# Altium schematic sheet RK3568-VO-Interface-1.SchDoc
size 420 x 297 mm; SheetNumber: 11; SheetTotal: 25
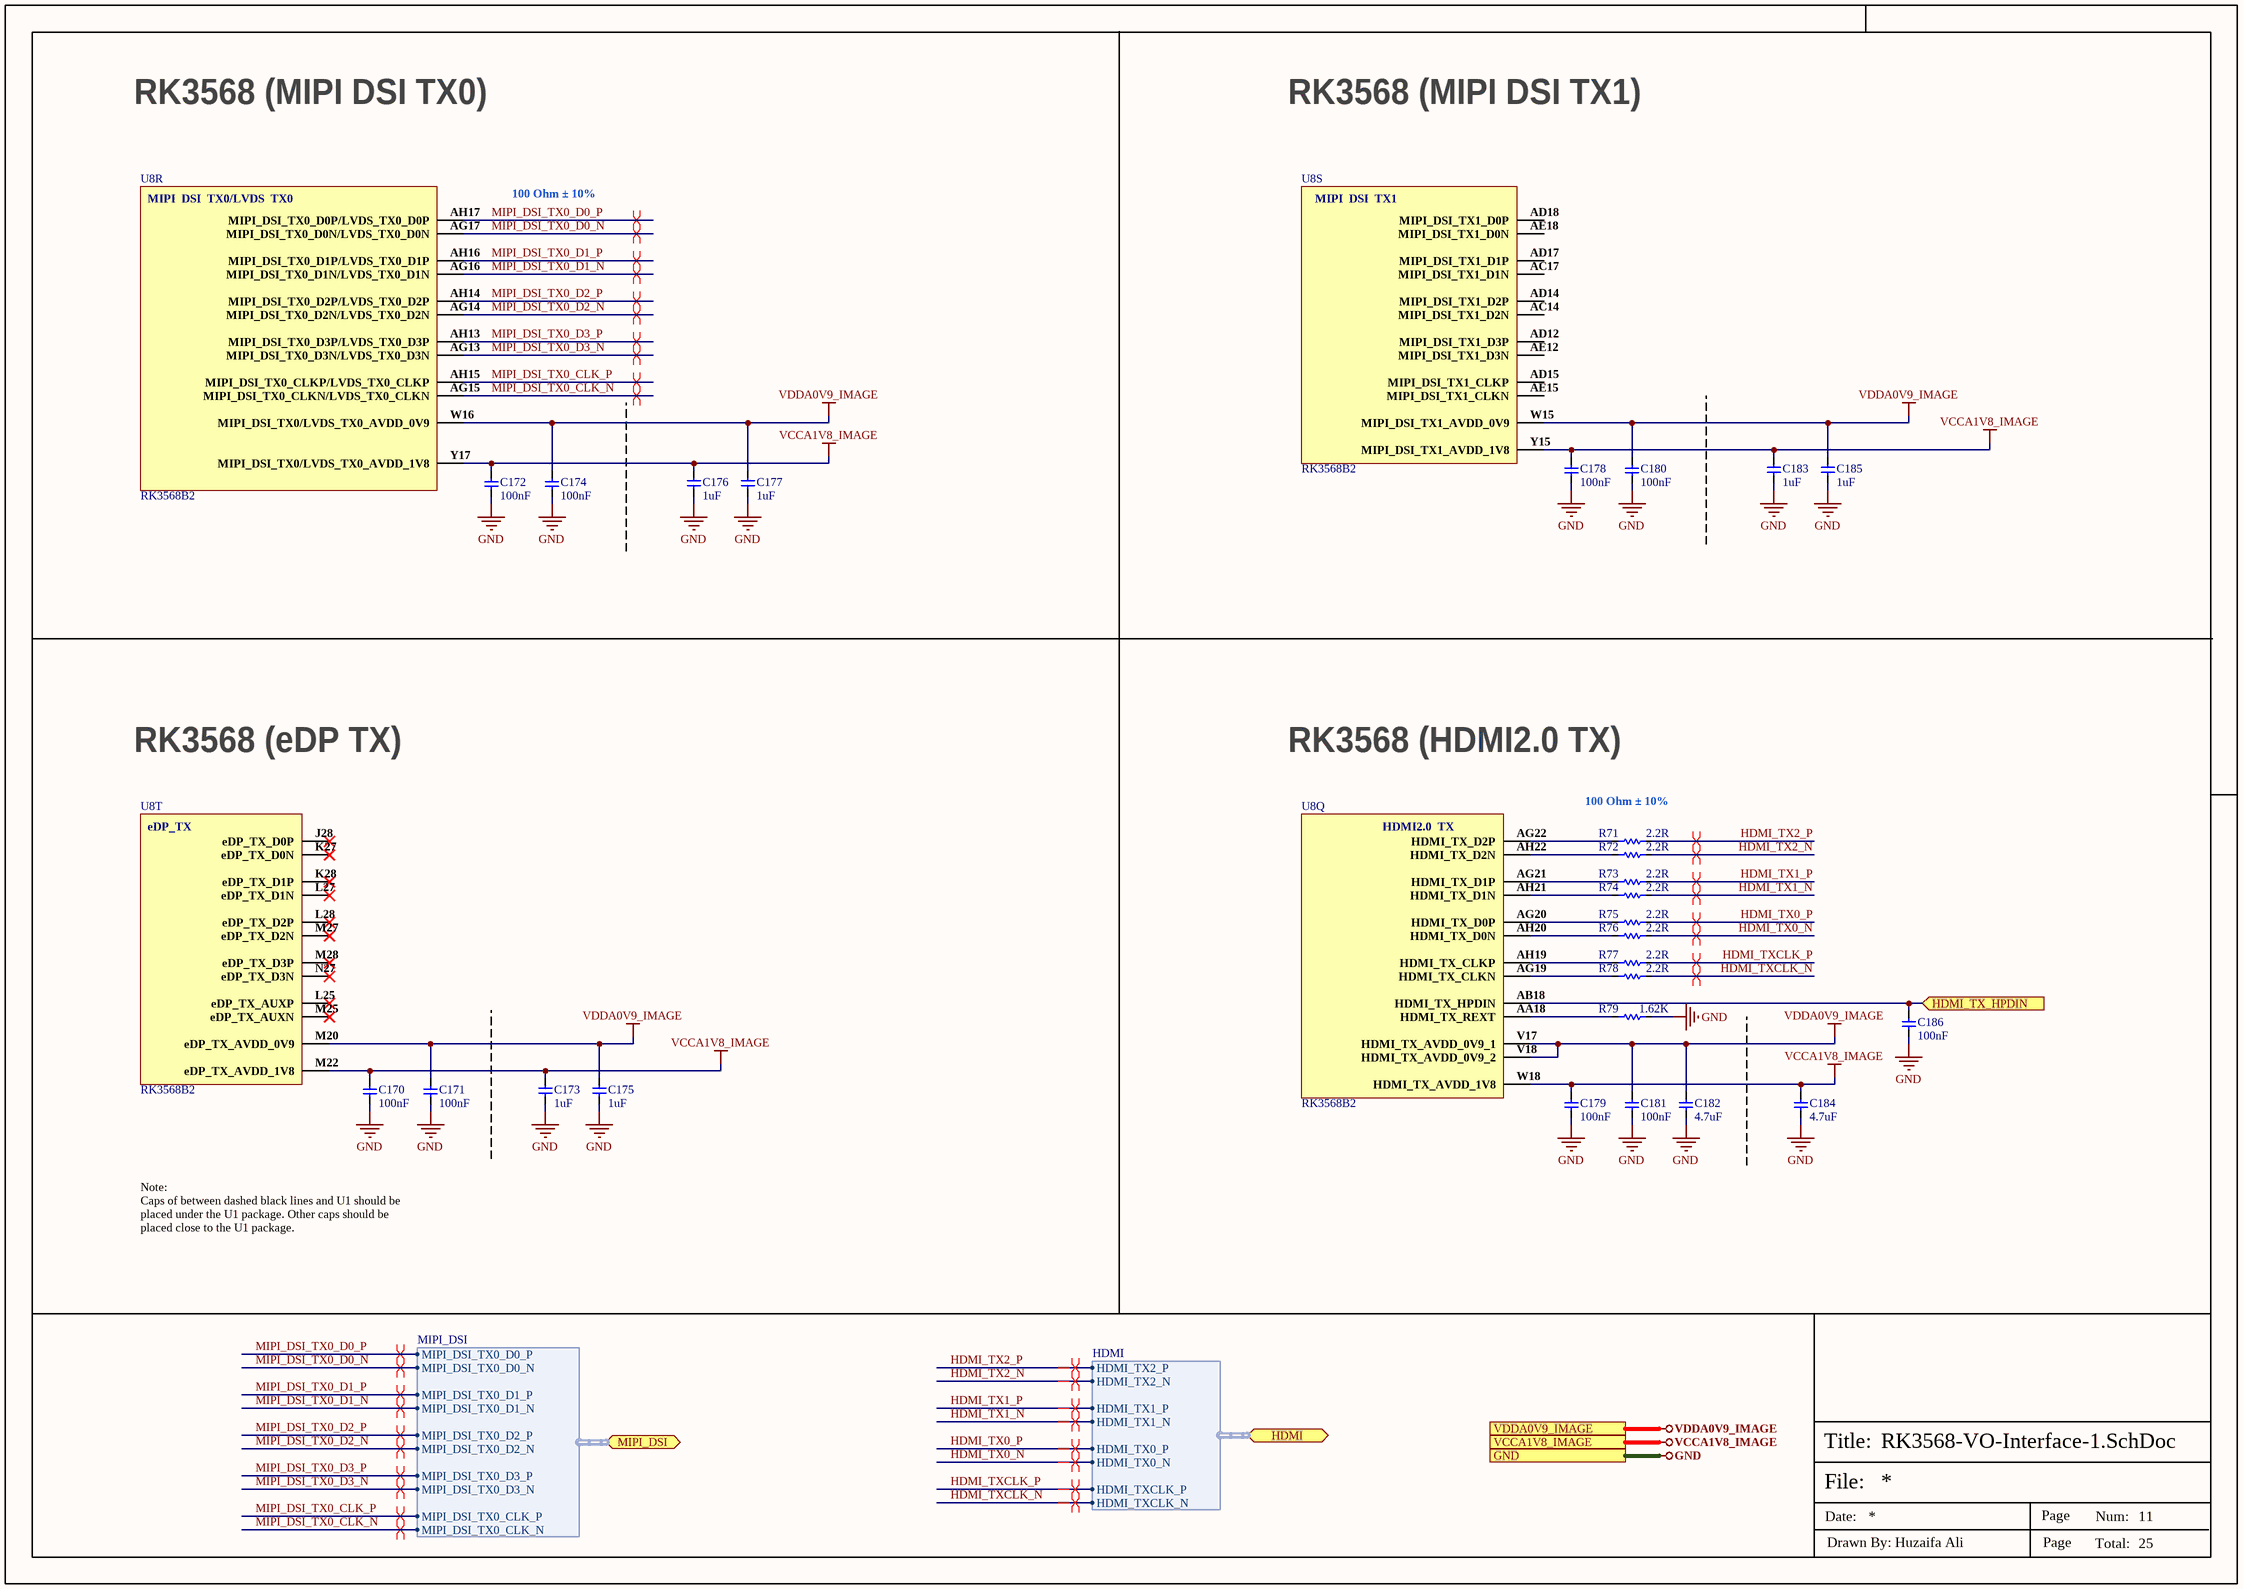
[diagram p0: RK3568-VO-Interface-1.SchDoc]

## Parts
C170  100nF  [CAP-0201]
C171  100nF  [CAP-0201]
C172  100nF  [CAP-0201]
C173  1uF  [Cap-0402]
C174  100nF  [CAP-0201]
C175  1uF  [Cap-0402]
C176  1uF  [Cap-0402]
C177  1uF  [Cap-0402]
C178  100nF  [CAP-0201]
C179  100nF  [CAP-0201]
C180  100nF  [CAP-0201]
C181  100nF  [CAP-0201]
C182  4.7uF  [Cap-0402]
C183  1uF  [Cap-0402]
C184  4.7uF  [Cap-0402]
C185  1uF  [Cap-0402]
C186  100nF  [CAP-0201]
R71  2.2R  [Res-0402]
R72  2.2R  [Res-0402]
R73  2.2R  [Res-0402]
R74  2.2R  [Res-0402]
R75  2.2R  [Res-0402]
R76  2.2R  [Res-0402]
R77  2.2R  [Res-0402]
R78  2.2R  [Res-0402]
R79  1.62K  [Res-0201]
U8  RK3568B2  [FCCSP-636L]  (parts Q,R,S,T of 23)

## Ports
GND (see Connector-Sheet[5D], DRAM-LPDDR4x-Sheet[4D], eMMC-Sheet[4D], LED-Debug-Sheet[4D], MicroSD-SPI-Flash-Sheet[4D], Power-DC-IN-Sheet[4D], Power-Others-Sheet[4D], Power-PMIC-Sheet[4D], RK3568-Audio-Interface[4D], RK3568-Flash-SD-Controller[4D], RK3568-OSC-PMUIO-Sheet[5D], RK3568-Power-Sheet[4D], RK3568-SARADC-GPIO[4D], RK3568-USB-PCIe-Sheet[5D], RK3568-VI-Interface-Sheet[4D], RK3568-VO-Interface-2[4D], Sensors-Sheet-1[4D], Sensors-Sheet-2[5D], Type-C-Sheet[4D], USB-Ports[4D], VO-HDMI2.0-TX-Sheet[4D], VO-LCM-MIPI-DSI-TX0[4D], WIFI-BT-SDIO-Sheet[4D]), HDMI (bidir, harness HDMI, see VO-HDMI2.0-TX-Sheet[2D]), HDMI_TX_HPDIN (in, see VO-HDMI2.0-TX-Sheet[1C]), MIPI_DSI (bidir, harness MIPI_DSI, see VO-LCM-MIPI-DSI-TX0[2D]), VCCA1V8_IMAGE (see Power-PMIC-Sheet[4D], RK3568-VI-Interface-Sheet[4D]), VDDA0V9_IMAGE (see Power-PMIC-Sheet[3D], RK3568-VI-Interface-Sheet[4D])

## Harnesses
MIPI_DSI: MIPI_DSI_TX0_D0_P, MIPI_DSI_TX0_D0_N, MIPI_DSI_TX0_D1_P, MIPI_DSI_TX0_D1_N, MIPI_DSI_TX0_D2_P, MIPI_DSI_TX0_D2_N, MIPI_DSI_TX0_D3_P, MIPI_DSI_TX0_D3_N, MIPI_DSI_TX0_CLK_P, MIPI_DSI_TX0_CLK_N
HDMI: HDMI_TX2_P, HDMI_TX2_N, HDMI_TX1_P, HDMI_TX1_N, HDMI_TX0_P, HDMI_TX0_N, HDMI_TXCLK_P, HDMI_TXCLK_N

## Nets
GND: C170.1 C171.1 C172.1 C173.2 C174.1 C175.2 C176.2 C177.2 C178.1 C179.1 C180.1 C181.1 C182.1 C183.2 C184.1 C185.2 C186.1 R79.2 ; port GND
VCCA1V8_IMAGE: C170.2 C172.2 C173.1 C176.1 C178.2 C179.2 C183.1 C184.2 U8.M22(eDP_TX_AVDD_1V8) U8.W18(HDMI_TX_AVDD_1V8) U8.Y15(MIPI_DSI_TX1_AVDD_1V8) U8.Y17(MIPI_DSI_TX0/LVDS_TX0_AVDD_1V8) ; port VCCA1V8_IMAGE
VDDA0V9_IMAGE: C171.2 C174.2 C175.1 C177.1 C180.2 C181.2 C182.2 C185.1 U8.M20(eDP_TX_AVDD_0V9) U8.V17(HDMI_TX_AVDD_0V9_1) U8.V18(HDMI_TX_AVDD_0V9_2) U8.W15(MIPI_DSI_TX1_AVDD_0V9) U8.W16(MIPI_DSI_TX0/LVDS_TX0_AVDD_0V9) ; port VDDA0V9_IMAGE
HDMI_TX0_N: R76.2 ; port HDMI.HDMI_TX0_N
HDMI_TX0_P: R75.2 ; port HDMI.HDMI_TX0_P
HDMI_TX1_N: R74.2 ; port HDMI.HDMI_TX1_N
HDMI_TX1_P: R73.2 ; port HDMI.HDMI_TX1_P
HDMI_TX2_N: R72.2 ; port HDMI.HDMI_TX2_N
HDMI_TX2_P: R71.2 ; port HDMI.HDMI_TX2_P
HDMI_TX_HPDIN: C186.2 U8.AB18(HDMI_TX_HPDIN) ; port HDMI_TX_HPDIN
HDMI_TXCLK_N: R78.2 ; port HDMI.HDMI_TXCLK_N
HDMI_TXCLK_P: R77.2 ; port HDMI.HDMI_TXCLK_P
MIPI_DSI_TX0_CLK_N: U8.AG15(MIPI_DSI_TX0_CLKN/LVDS_TX0_CLKN) ; port MIPI_DSI.MIPI_DSI_TX0_CLK_N
MIPI_DSI_TX0_CLK_P: U8.AH15(MIPI_DSI_TX0_CLKP/LVDS_TX0_CLKP) ; port MIPI_DSI.MIPI_DSI_TX0_CLK_P
MIPI_DSI_TX0_D0_N: U8.AG17(MIPI_DSI_TX0_D0N/LVDS_TX0_D0N) ; port MIPI_DSI.MIPI_DSI_TX0_D0_N
MIPI_DSI_TX0_D0_P: U8.AH17(MIPI_DSI_TX0_D0P/LVDS_TX0_D0P) ; port MIPI_DSI.MIPI_DSI_TX0_D0_P
MIPI_DSI_TX0_D1_N: U8.AG16(MIPI_DSI_TX0_D1N/LVDS_TX0_D1N) ; port MIPI_DSI.MIPI_DSI_TX0_D1_N
MIPI_DSI_TX0_D1_P: U8.AH16(MIPI_DSI_TX0_D1P/LVDS_TX0_D1P) ; port MIPI_DSI.MIPI_DSI_TX0_D1_P
MIPI_DSI_TX0_D2_N: U8.AG14(MIPI_DSI_TX0_D2N/LVDS_TX0_D2N) ; port MIPI_DSI.MIPI_DSI_TX0_D2_N
MIPI_DSI_TX0_D2_P: U8.AH14(MIPI_DSI_TX0_D2P/LVDS_TX0_D2P) ; port MIPI_DSI.MIPI_DSI_TX0_D2_P
MIPI_DSI_TX0_D3_N: U8.AG13(MIPI_DSI_TX0_D3N/LVDS_TX0_D3N) ; port MIPI_DSI.MIPI_DSI_TX0_D3_N
MIPI_DSI_TX0_D3_P: U8.AH13(MIPI_DSI_TX0_D3P/LVDS_TX0_D3P) ; port MIPI_DSI.MIPI_DSI_TX0_D3_P
NetR71_1: R71.1 U8.AG22(HDMI_TX_D2P)
NetR72_1: R72.1 U8.AH22(HDMI_TX_D2N)
NetR73_1: R73.1 U8.AG21(HDMI_TX_D1P)
NetR74_1: R74.1 U8.AH21(HDMI_TX_D1N)
NetR75_1: R75.1 U8.AG20(HDMI_TX_D0P)
NetR76_1: R76.1 U8.AH20(HDMI_TX_D0N)
NetR77_1: R77.1 U8.AH19(HDMI_TX_CLKP)
NetR78_1: R78.1 U8.AG19(HDMI_TX_CLKN)
NetR79_1: R79.1 U8.AA18(HDMI_TX_REXT)

Not connected (* = marked no-connect by the designer): U8 AC14(MIPI_DSI_TX1_D2N) AC17(MIPI_DSI_TX1_D1N) AD12(MIPI_DSI_TX1_D3P) AD14(MIPI_DSI_TX1_D2P) AD15(MIPI_DSI_TX1_CLKP) AD17(MIPI_DSI_TX1_D1P) AD18(MIPI_DSI_TX1_D0P) AE12(MIPI_DSI_TX1_D3N) AE15(MIPI_DSI_TX1_CLKN) AE18(MIPI_DSI_TX1_D0N) J28(eDP_TX_D0P)* K27(eDP_TX_D0N)* K28(eDP_TX_D1P)* L25(eDP_TX_AUXP)* L27(eDP_TX_D1N)* L28(eDP_TX_D2P)* M25(eDP_TX_AUXN)* M27(eDP_TX_D2N)* M28(eDP_TX_D3P)* N27(eDP_TX_D3N)*

## Layout directives
differential pair: HDMI_TX0_N, HDMI_TX0_P, HDMI_TX1_N, HDMI_TX1_P, HDMI_TX2_N, HDMI_TX2_P, HDMI_TXCLK_N, HDMI_TXCLK_P, MIPI_DSI_TX0_CLK_N, MIPI_DSI_TX0_CLK_P, MIPI_DSI_TX0_D0_N, MIPI_DSI_TX0_D0_P, MIPI_DSI_TX0_D1_N, MIPI_DSI_TX0_D1_P, MIPI_DSI_TX0_D2_N, MIPI_DSI_TX0_D2_P, MIPI_DSI_TX0_D3_N, MIPI_DSI_TX0_D3_P

## Notes on the sheet
- RK3568 (MIPI DSI TX0)
- RK3568 (MIPI DSI TX1)
- 100 Ohm ± 10%
- RK3568 (eDP TX)
- RK3568 (HDMI2.0 TX)
- Note:
  Caps of between dashed black lines and U1 should be placed under the U1 package. Other caps should be placed close to the U1 package.
- File:
- Title:
- Date:
- Page
- Num:
- Total:
- Drawn By: Huzaifa Ali
- (in symbol RK3568B2, part Q) HDMI2.0  TX
- (in symbol RK3568B2, part R) MIPI  DSI  TX0/LVDS  TX0
- (in symbol RK3568B2, part S) MIPI  DSI  TX1
- (in symbol RK3568B2, part T) eDP_TX

## Library data of the parts
C170-C172 C174 C178-C181 C186 = CC0201KRX5R6BB104: CAP CER 0.1UF 10V X5R 0201; Manufacturer: Yageo; Tolerance: 10%; Supplier 1: Mouser; Manufacturer Part Number: CC0201KRX5R6BB104; RoHS: Yes; Category: Ceramic Capacitors; Stock 1: 824403; Pricing 1: 1=0.10000, 10=0.02400, 50=0.02400, 100=0.01900, 1000=0.01100, 10000=0.00900 (USD); Mount: Surface Mount; Case/Package: 0201; Case Code (Imperial): 0201; Case Code (Metric): 0603; Weight: 6E-06oz; Min Operating Temperature: -55°C; Max Operating Temperature: 85°C; Capacitance: 100nF; Dielectric: X5R; Voltage Rating (DC): 10V; Packaging: Tape and Reel; Termination: SMD/SMT; Resistor Type: Ceramic; Voltage Rating: 10V; Series: CC; Construction: Flat; Length: 0.6mm; Width: 0.012inch; Height: 0.3mm; Thickness: 0.013inch; Depth: 0.3mm; Radiation Hardening: No; Lead Free: Lead Free; Halogen Free: Halogen Free; RoHS Compliant: Yes; ComponentLink1URL: https://datasheet.ciiva.com/11587/upy-gphc-x5r-4v-to-50v-12-11587190.pdf?src-supplier=Avnet; ComponentLink1Description: https://datasheet.ciiva.com/11587/upy-gphc-x5r-4v-to-50v-12-11587190.pdf?src-supplier=Avnet; Supplier Part Number 1: 603-CC201KRX5R6BB104; LCSC Part Number: C190183
C173 C175-C177 C183 C185 = CC0402KRX5R6BB105: CAP CER 1UF 10V X5R 0402; Manufacturer: Yageo; Tolerance: 10%; Dissipation Factor: 15%; Item Type: Capacitor; Supplier 1: Mouser; Manufacturer Part Number: CC0402KRX5R6BB105; RoHS: Yes; Category: Ceramic Capacitors; Stock 1: 6711367; Pricing 1: 1=0.11000, 10=0.05500, 50=0.05500, 100=0.03300, 500=0.02700, 1000=0.02200, 2500=0.02100, 10000=0.01800 (USD); Mount: Surface Mount; Case/Package: 0402; Number of Pins: 2; Case Code (Metric): 1005; Case Code (Imperial): 0402; Min Operating Temperature: -55°C; Max Operating Temperature: 85°C; Capacitance: 1uF; Dielectric: X5R; Package Quantity: 1; Voltage Rating: 10V; Packaging: Tape and Reel; Voltage Rating (DC): 10V; Termination: SMD/SMT; Resistor Type: Ceramic; Series: CC; Construction: Flat; Length: 1mm; Width: 0.02inch; Height: 0.5mm; Thickness: 0.022inch; Depth: 0.5mm; Radiation Hardening: No; REACH SVHC: No SVHC; Lead Free: Lead Free; Halogen Free: Halogen Free; RoHS Compliant: Yes; ComponentLink1URL: https://datasheet.ciiva.com/176/upy-gphc-x5r-4v-to-50v-12-176704.pdf?src-supplier=Digi-Key; ComponentLink1Description: https://datasheet.ciiva.com/176/upy-gphc-x5r-4v-to-50v-12-176704.pdf?src-supplier=Digi-Key; ComponentLink2URL: https://datasheet.ciiva.com/176/mlccorderingcode-176705.pdf?src-supplier=Digi-Key; ComponentLink2Description: https://datasheet.ciiva.com/176/mlccorderingcode-176705.pdf?src-supplier=Digi-Key; ComponentLink3URL: https://datasheet.ciiva.com/176/mlccorderingcode-176706.pdf?src-supplier=Digi-Key; ComponentLink3Description: https://datasheet.ciiva.com/176/mlccorderingcode-176706.pdf?src-supplier=Digi-Key; Supplier Part Number 1: 603-CC402KRX5R6BB105; LCSC Part Number: C106254
C182 C184 = CC0402KRX5R5BB475: CAP CER 4.7UF 6.3V X5R 0402; Manufacturer: Yageo; Tolerance: 10%; Item Type: Capacitor; Supplier 1: Arrow Electronics; Manufacturer Part Number: CC0402KRX5R5BB475; RoHS: Yes; Category: Ceramic Capacitors; Stock 1: 890000; Pricing 1: 10000=0.02120, 20000=0.02030, 30000=0.02010, 50000=0.01930, 100000=0.01760, 250000=0.01630 (USD); Case/Package: 0402; Voltage Rating (DC): 6.3V; Dielectric: X5R; Capacitance: 4.7uF; Lead Free: Lead Free; Halogen Free: Halogen Free; RoHS Compliant: Yes; ComponentLink1URL: http://www.yageo.com/documents/recent/UPY-GPHC_X5R_4V-to-50V_25.pdf?src-supplier=Digi-Key; ComponentLink1Description: http://www.yageo.com/documents/recent/UPY-GPHC_X5R_4V-to-50V_25.pdf?src-supplier=Digi-Key; ComponentLink2URL: https://www.yageo.com/upload/media/product/productsearch/datasheet/mlcc/UPY-GPHC_X5R_4V-to-50V_26.pdf?src-supplier=Digi-Key; ComponentLink2Description: https://www.yageo.com/upload/media/product/productsearch/datasheet/mlcc/UPY-GPHC_X5R_4V-to-50V_26.pdf?src-supplier=Digi-Key; LCSC Part Number: C541466; Supplier Part Number 1: CC0402KRX5R5BB475
R71-R78 = RC0402FR-072R2L: RES 2.2 OHM 1% 1/16W 0402; Manufacturer: Yageo; Power Rating: 63mW; Voltage Rating: 50V; Temperature Coefficient: 200ppm/°C; Supplier 1: Digi-Key; Manufacturer Part Number: RC0402FR-072R2L; RoHS: Yes; Category: Chip SMD Resistors; Stock 1: 828995; Pricing 1: 1=0.10000, 10=0.02300, 100=0.00930, 1000=0.00416, 2500=0.00361, 5000=0.00298 (USD); Case/Package: 0402; Number of Pins: 2; Case Code (Imperial): 0402; Case Code (Metric): 1005; Size Code: 0402; Min Operating Temperature: -55°C; Max Operating Temperature: 155°C; Resistor Type: Thick Film; Resistance: 2.2R; Tolerance: 1%; Packaging: Tape and Reel; Termination: SMD/SMT; Voltage Rating (DC): 50V; Features: Moisture Resistant; Series: RC; Max Power Dissipation: 63mW; Number of Terminations: 2; Resistance Tolerance: 1%; Technology: THICK FILM; Length: 1mm; Width: 0.5mm; Height: 0.32mm; Depth: 0.5mm; RoHS Compliant: Yes; REACH SVHC: No SVHC; Lead Free: Lead Free; ComponentLink1URL: https://datasheet.ciiva.com/11808/0900766b80c66297-11808447.pdf?src-supplier=RSComponents; ComponentLink1Description: https://datasheet.ciiva.com/11808/0900766b80c66297-11808447.pdf?src-supplier=RSComponents; ComponentLink2URL: https://datasheet.ciiva.com/7849/1018594-7849944.pdf?src-supplier=Element14; ComponentLink2Description: https://datasheet.ciiva.com/7849/1018594-7849944.pdf?src-supplier=Element14; ComponentLink3URL: https://datasheet.ciiva.com/7849/1018594-7849945.pdf?src-supplier=Element14; ComponentLink3Description: https://datasheet.ciiva.com/7849/1018594-7849945.pdf?src-supplier=Element14; ComponentLink4URL: https://datasheet.ciiva.com/12668/pyu-rc0402-51-rohs-l-6-r-12668221.pdf?src-supplier=Mouser; ComponentLink4Description: https://datasheet.ciiva.com/12668/pyu-rc0402-51-rohs-l-6-r-12668221.pdf?src-supplier=Mouser; ComponentLink5URL: https://datasheet.ciiva.com/17070/pyu-rc0402-51-rohs-l-6-r-17070495.pdf?src-supplier=Future+Electronics; ComponentLink5Description: https://datasheet.ciiva.com/17070/pyu-rc0402-51-rohs-l-6-r-17070495.pdf?src-supplier=Future+Electronics; Supplier Part Number 1: 311-2.20LRCT-ND; LCSC Part Number: C327251
R79 = RC0201DR-071K62L: RES 1.62K OHM 0.5% 1/20W 0201; Manufacturer: Yageo; Value: 1.62kR; Max Power Dissipation: 50mW; Temperature Coefficient: 200ppm/°C; Item Type: Resistor; Supplier: Avnet; Supplier Part Number: RC0201DR-071K62L; Manufacturer Part Number: RC0201DR-071K62L; RoHS: Yes; Category: Chip SMD Resistors; Pricing: 10000=0.01131 (USD); Case/Package: 0201; Min Operating Temperature: -55°C; Max Operating Temperature: 125°C; Packaging: Tape and Reel; Number of Terminations: 2; Tolerance: 0.5%; Features: Moisture Resistant; Series: RC; Length: 0.024inch; Width: 0.012inch; Height: 0.01inch; RoHS Compliant: Yes; ComponentLink1URL: http://www.yageo.com.tw/exep/pages/download/literatures/PYu-R_INT-thick_7.pdf?src-supplier=Digikey; ComponentLink1Description: http://www.yageo.com.tw/exep/pages/download/literatures/PYu-R_INT-thick_7.pdf?src-supplier=Digikey; LCSC Part Number: C851673
U8 = RK3568B2: FCCSP-636L Microcontroller Units (MCUs/MPUs/SOCs) ROHS; Manufacturer: Rockchip; Item Type: IC; Manufacturer Part Number: RK3568B2; Package: FCCSP-636L; LCSC Part Number: C3345225